# Altium schematic sheet BatterySystem.SchDoc
size A; SheetNumber: 3; SheetTotal: 6
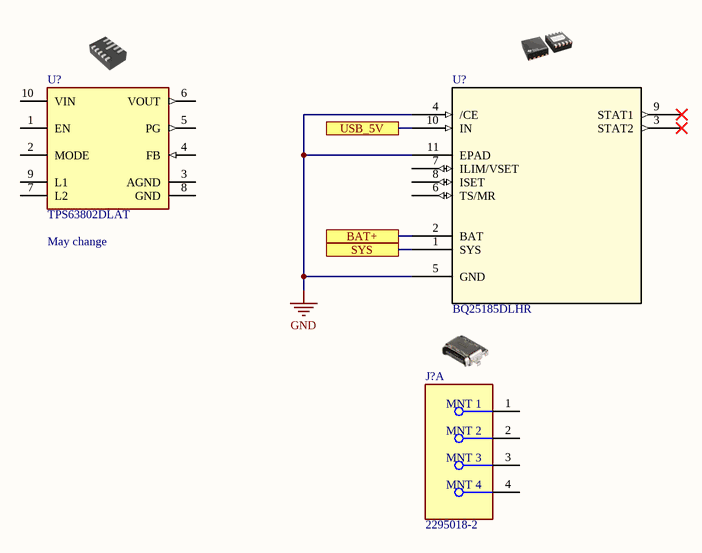
[diagram p0: BatterySystem.SchDoc]

## Parts
(Parts that share a designator on the sheet are numbered #1, #2 ... from top to bottom, then left to right.)
J?  2295018-2  [FP-2295018-2-MFG]  (part A of 3)
U?#1  TPS63802DLAT  [FP-DLA0010A-MFG]
U?#2  BQ25185DLHR  [WSON10_DLH_TEX]

## Ports
BAT+, SYS, USB_5V

## Nets
GND: U?#2.4(/CE) U?#2.5(GND) U?#2.11(EPAD)
BAT+: U?#2.2(BAT) ; port BAT+
SYS: U?#2.1(SYS) ; port SYS
USB_5V: U?#2.10(IN) ; port USB_5V

Not connected (* = marked no-connect by the designer): J? 1(MNT_1) 2(MNT_2) 3(MNT_3) 4(MNT_4); U?#1 1(EN) 2(MODE) 3(AGND) 4(FB) 5(PG) 6(VOUT) 7(L2) 8(GND) 9(L1) 10(VIN); U?#2 3(STAT2)* 6(TS/MR) 7(ILIM/VSET) 8(ISET) 9(STAT1)*

## Notes on the sheet
- (near U?#1) May change

## Library data of the parts
J? = CMP-03360-000011-1: CONN RCPT USB3.1 TYPEC 24POS SMD; Plating: Bright; Contact Current Rating: 5A; Connector System: Cable-to-Board; Number of Ports: 1; Circuit Application: Signal; Number of Positions: 24; Gender: Receptacle; Pitch: 0.5mm; Lead Free: Lead Free; Packaging: Tape and Reel; Min Operating Temperature: -30°C; RoHS Compliant: Yes; Housing Color: Black; Housing Material: Thermoplastic; Orientation: Right Angle; Connector Type: Receptacle; Max Operating Temperature: 85°C; USB Standard: USB 3.1; Contact Material: Copper Alloy; Contact Plating: Gold; Termination: SMD/SMT
U?#1 = CMP-04918-000461-1: IC POWER MANAGEMENT; RoHS Compliant: Yes
U?#2 = BQ25185DLHR: 1-cell, 1-A stand-alone linear battery charger with power path and solar input support 10-WSON -40 to 125; Manufacturer_Name: Texas Instruments; Type: Power Management; Copyright: Copyright (C) 2025 Ultra Librarian. All rights reserved.; Manufacturer_Part_Number: BQ25185DLHR; RefDes: RefDes